# Altium schematic sheet 10_Taxi_Toplight.SchDoc: Taxi_Toplight
size A4; SheetNumber: 11; SheetTotal: 12
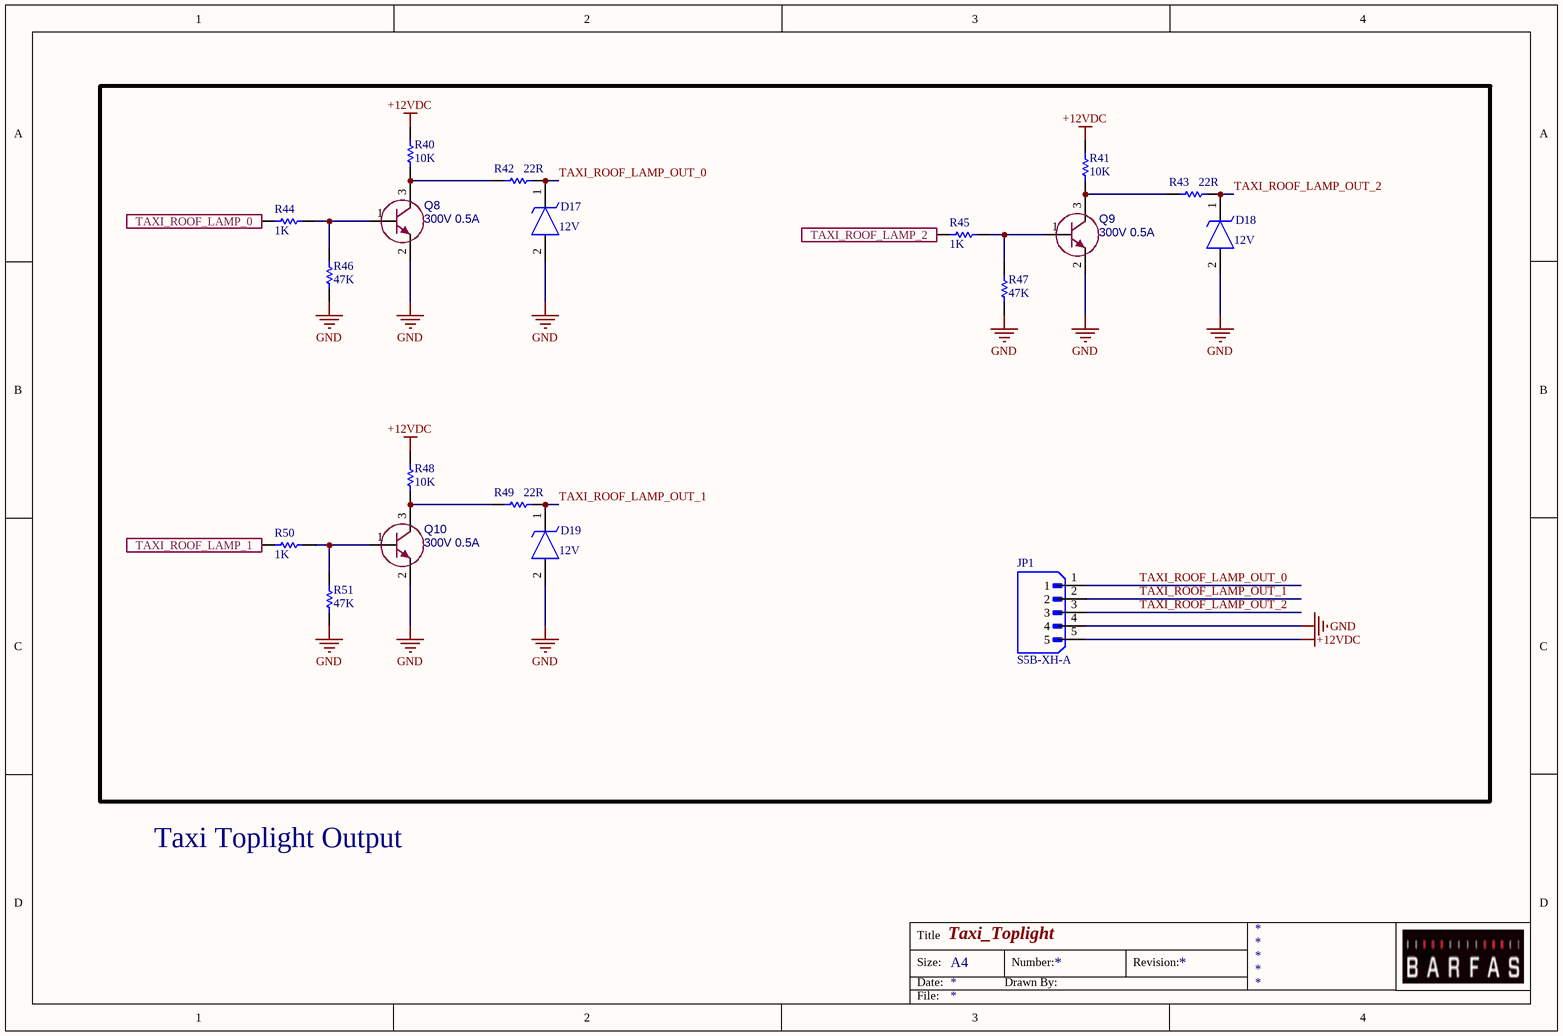
[diagram p0: 10_Taxi_Toplight.SchDoc]

## Parts
D17  value 12V  [DIOM5436X244N]  (hidden comment: SMBJ12A)
D18  value 12V  [DIOM5436X244N]  (hidden comment: SMBJ12A)
D19  value 12V  [DIOM5436X244N]  (hidden comment: SMBJ12A)
JP1  S5B-XH-A  [JST_S5B-XH-A]
Q8  value 300V 0.5A  [SOT-23-3]  (hidden comment: MMBTA42_R1_00001)
Q9  value 300V 0.5A  [SOT-23-3]  (hidden comment: MMBTA42_R1_00001)
Q10  value 300V 0.5A  [SOT-23-3]  (hidden comment: MMBTA42_R1_00001)
R40  value 10K  [RES_0402]  (hidden comment: RC0402JR-0710KL)
R41  value 10K  [RES_0402]  (hidden comment: RC0402JR-0710KL)
R42  value 22R  [RES_0603]  (hidden comment: 0603SAJ0220T5E)
R43  value 22R  [RES_0603]  (hidden comment: 0603SAJ0220T5E)
R44  value 1K  [RES_0603]  (hidden comment: 0603SAF1001T5E)
R45  value 1K  [RES_0603]  (hidden comment: 0603SAF1001T5E)
R46  value 47K  [RES_0603]  (hidden comment: 0603SAF4702T5E)
R47  value 47K  [RES_0603]  (hidden comment: 0603SAF4702T5E)
R48  value 10K  [RES_0402]  (hidden comment: RC0402JR-0710KL)
R49  value 22R  [RES_0603]  (hidden comment: 0603SAJ0220T5E)
R50  value 1K  [RES_0603]  (hidden comment: 0603SAF1001T5E)
R51  value 47K  [RES_0603]  (hidden comment: 0603SAF4702T5E)

## Ports
TAXI_ROOF_LAMP_0 (in), TAXI_ROOF_LAMP_1 (in), TAXI_ROOF_LAMP_2 (in)

## Nets
+12VDC: JP1.5 R40.1 R41.1 R48.1
GND: D17.2(A) D18.2(A) D19.2(A) JP1.4 Q8.2(E) Q9.2(E) Q10.2(E) R46.1 R47.1 R51.1
TAXI_ROOF_LAMP_0: R44.2 ; port TAXI_ROOF_LAMP_0
TAXI_ROOF_LAMP_1: R50.2 ; port TAXI_ROOF_LAMP_1
TAXI_ROOF_LAMP_2: R45.2 ; port TAXI_ROOF_LAMP_2
TAXI_ROOF_LAMP_OUT_0: D17.1(K) JP1.1 R42.2
TAXI_ROOF_LAMP_OUT_1: D19.1(K) JP1.2 R49.2
TAXI_ROOF_LAMP_OUT_2: D18.1(K) JP1.3 R43.2
NetQ8_1: Q8.1(B) R44.1 R46.2
NetQ8_3: Q8.3(C) R40.2 R42.1
NetQ9_1: Q9.1(B) R45.1 R47.2
NetQ9_3: Q9.3(C) R41.2 R43.1
NetQ10_1: Q10.1(B) R50.1 R51.2
NetQ10_3: Q10.3(C) R48.2 R49.1

## Notes on the sheet
- Taxi Toplight Output
- Title
- Size:
- Date:
- A4
- Drawn By:
- Number:
- Revision:
- File:

## Library data of the parts
D17-D19 = SMBJ12A: TVS, UNI-DIR, 600W, 12V, DO-214A; Manufacturer: Good-Ark Semiconductor; Manufacturer Part Number: SMBJ12A
JP1 = S5B-XH-A: Connector Header Through Hole, Right Angle 5 position 0.098 (2.50mm); MF: JST Sales; SnapEDA_Link: https://www.snapeda.com/parts/S5B-XH-A/JST+Sales+America+Inc./view-part/?ref=snap; Package: None; Value: *; MP: S5B-XH-A; Check_prices: https://www.snapeda.com/parts/S5B-XH-A/JST+Sales+America+Inc./view-part/?ref=eda
Q8-Q10 = MMBTA42_R1_00001: TRANSISTOR DIS.500mA 300V NPN SOT23 GEN. SMT; Manufacturer: PANJIT; Package: SOT23; Supplier Part Number 1: 3757-MMBTA42_R1_00001CT-ND; Supplier Part Number 2: *; Supplier Part Number 3: MMBTA42_R1_00001; Supplier 1: DIGIKEY; Supplier 2: MOUSER; Supplier 3: OZDISAN; Manufacturer Part Number: MMBTA42_R1_00001
R40 R41 R48 = R03000: RES.(1005) 0402 10K Ohms 5% 1/16W 100PPM SMT; Manufacturer: YAGEO; Manufacturer Part Number: RC0402JR-0710KL
R42 R43 R49 = 0603SAJ0220T5E: RES.(1608) 0603 22 Ohms 5% 1/10W-S 200PPM; Manufacturer: ROYALOHM; Supplier 1: Ozdisan; Manufacturer Part Number: 0603SAJ0220T5E
R44 R45 R50 = 0603SAF1001T5E: RES.(1608) 0603 1K Ohms 1% 1/10W-S 100PPM; Manufacturer: ROYALOHM; Supplier 1: Ozdisan; Manufacturer Part Number: 0603SAF1001T5E
R46 R47 R51 = 0603SAF4702T5E: RES.(1608) 0603 47K Ohms 1% 1/10W-S 100PPM; Manufacturer: ROYALOHM; Supplier 1: Ozdisan; Manufacturer Part Number: 0603SAF4702T5E